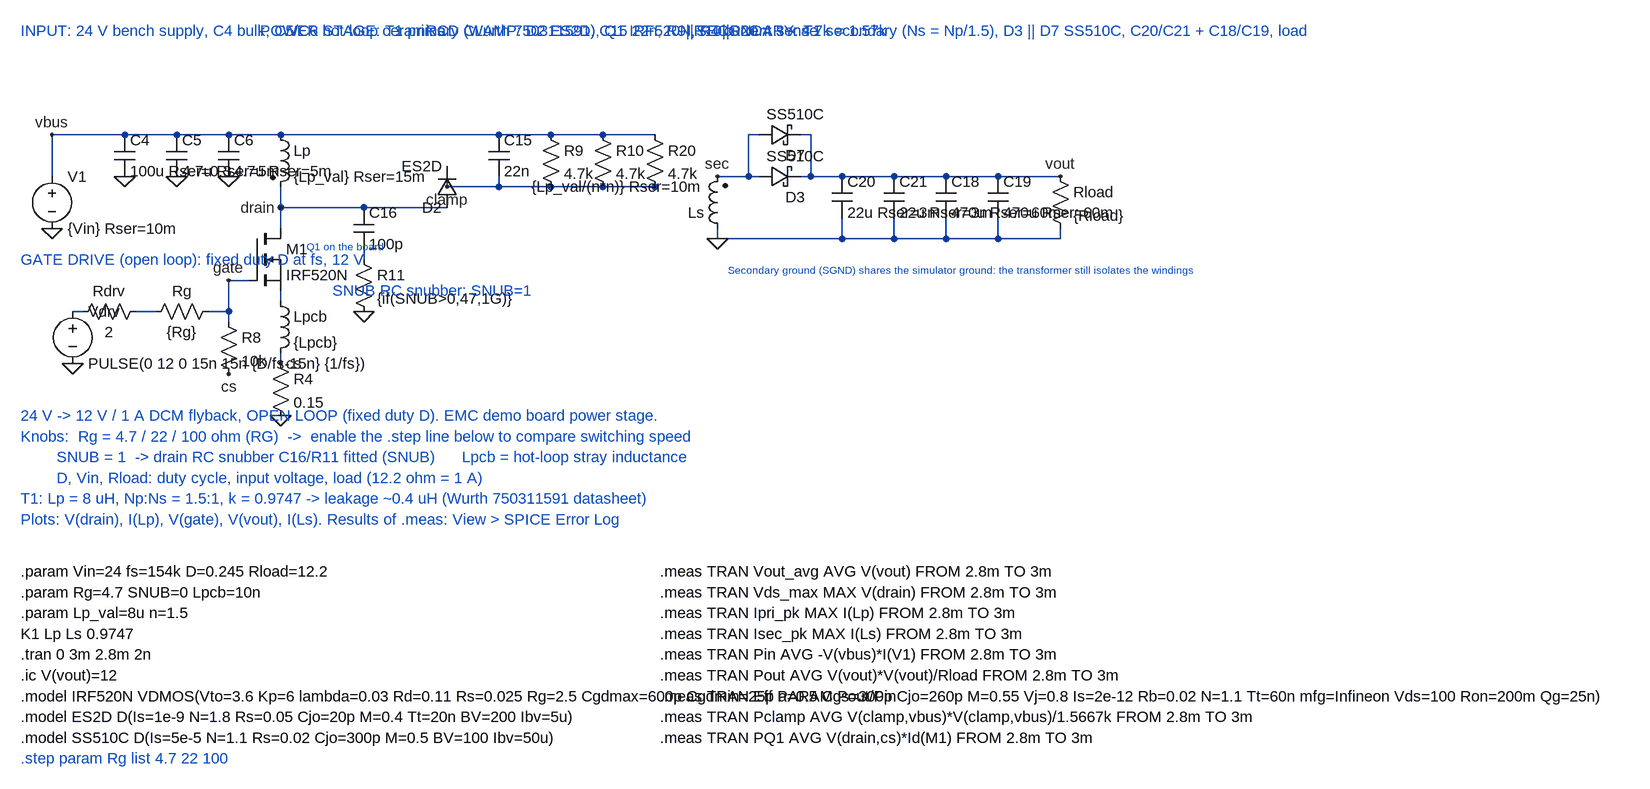
[diagram p0: schematic EMC_flyback_power_stage.asc]
EMC_flyback_power_stage.asc, the LTspice schematic file:
Version 4
SHEET 1 1840 1040
WIRE 64 192 64 128
WIRE 64 128 176 128
WIRE 176 128 256 128
WIRE 256 128 336 128
WIRE 336 128 416 128
WIRE 416 128 752 128
WIRE 752 128 832 128
WIRE 832 128 912 128
WIRE 912 128 992 128
WIRE 416 208 416 240
WIRE 416 240 416 272
WIRE 416 368 416 384
WIRE 416 464 416 480
WIRE 96 400 112 400
WIRE 192 400 224 400
WIRE 304 400 336 400
WIRE 336 400 336 352
WIRE 336 352 368 352
WIRE 336 400 336 416
WIRE 416 240 544 240
WIRE 544 304 544 320
WIRE 544 240 672 240
WIRE 672 176 672 208
WIRE 672 208 752 208
WIRE 752 208 832 208
WIRE 832 208 912 208
WIRE 912 208 992 208
WIRE 752 192 752 208
WIRE 832 208 832 208
WIRE 912 208 912 208
WIRE 992 208 992 208
WIRE 1088 192 1136 192
WIRE 1136 192 1152 192
WIRE 1216 192 1232 192
WIRE 1232 192 1280 192
WIRE 1280 192 1360 192
WIRE 1360 192 1440 192
WIRE 1440 192 1520 192
WIRE 1520 192 1616 192
WIRE 1136 192 1136 128
WIRE 1136 128 1152 128
WIRE 1216 128 1232 128
WIRE 1232 128 1232 192
WIRE 1280 256 1280 288
WIRE 1360 256 1360 288
WIRE 1440 256 1440 288
WIRE 1520 256 1520 288
WIRE 1616 272 1616 288
WIRE 1088 272 1088 288
WIRE 1088 288 1280 288
WIRE 1280 288 1360 288
WIRE 1360 288 1440 288
WIRE 1440 288 1520 288
WIRE 1520 288 1616 288
FLAG 64 272 0
FLAG 176 192 0
FLAG 256 192 0
FLAG 336 192 0
FLAG 64 128 vbus
FLAG 416 240 drain
FLAG 416 560 0
FLAG 416 480 cs
FLAG 96 480 0
FLAG 336 496 cs
FLAG 336 352 gate
FLAG 544 400 0
FLAG 672 208 clamp
FLAG 1088 192 sec
FLAG 1616 192 vout
FLAG 1088 288 0
SYMBOL voltage 64 176 R0
SYMATTR InstName V1
SYMATTR Value {Vin} Rser=10m
SYMBOL cap 160 128 R0
SYMATTR InstName C4
SYMATTR Value 100u Rser=0.3
SYMBOL cap 240 128 R0
SYMATTR InstName C5
SYMATTR Value 4.7u Rser=5m
SYMBOL cap 320 128 R0
SYMATTR InstName C6
SYMATTR Value 4.7u Rser=5m
SYMBOL ind2 400 112 R0
SYMATTR InstName Lp
SYMATTR Value {Lp_val} Rser=15m
SYMBOL nmos 368 272 R0
SYMATTR InstName M1
SYMATTR Value IRF520N
SYMBOL ind 400 368 R0
SYMATTR InstName Lpcb
SYMATTR Value {Lpcb}
SYMBOL res 400 464 R0
SYMATTR InstName R4
SYMATTR Value 0.15
SYMBOL voltage 96 384 R0
SYMATTR InstName Vdrv
SYMATTR Value PULSE(0 12 0 15n 15n {D/fs-15n} {1/fs})
SYMBOL res 208 384 R90
WINDOW 0 0 56 VBottom 2
WINDOW 3 32 56 VTop 2
SYMATTR InstName Rdrv
SYMATTR Value 2
SYMBOL res 320 384 R90
WINDOW 0 0 56 VBottom 2
WINDOW 3 32 56 VTop 2
SYMATTR InstName Rg
SYMATTR Value {Rg}
SYMBOL res 320 400 R0
SYMATTR InstName R8
SYMATTR Value 10k
SYMBOL cap 528 240 R0
SYMATTR InstName C16
SYMATTR Value 100p
SYMBOL res 528 304 R0
SYMATTR InstName R11
SYMATTR Value {if(SNUB>0,47,1G)}
SYMBOL diode 688 240 R180
SYMATTR InstName D2
SYMATTR Value ES2D
SYMBOL cap 736 128 R0
SYMATTR InstName C15
SYMATTR Value 22n
SYMBOL res 816 112 R0
SYMATTR InstName R9
SYMATTR Value 4.7k
SYMBOL res 896 112 R0
SYMATTR InstName R10
SYMATTR Value 4.7k
SYMBOL res 976 112 R0
SYMATTR InstName R20
SYMATTR Value 4.7k
SYMBOL ind2 1104 288 R180
SYMATTR InstName Ls
SYMATTR Value {Lp_val/(n*n)} Rser=10m
SYMBOL schottky 1152 208 R270
WINDOW 0 0 56 VBottom 2
WINDOW 3 32 56 VTop 2
SYMATTR InstName D3
SYMATTR Value SS510C
SYMBOL schottky 1152 144 R270
WINDOW 0 0 56 VBottom 2
WINDOW 3 32 56 VTop 2
SYMATTR InstName D7
SYMATTR Value SS510C
SYMBOL cap 1264 192 R0
SYMATTR InstName C20
SYMATTR Value 22u Rser=3m
SYMBOL cap 1344 192 R0
SYMATTR InstName C21
SYMATTR Value 22u Rser=3m
SYMBOL cap 1424 192 R0
SYMATTR InstName C18
SYMATTR Value 470u Rser=60m
SYMBOL cap 1504 192 R0
SYMATTR InstName C19
SYMATTR Value 470u Rser=60m
SYMBOL res 1600 176 R0
SYMATTR InstName Rload
SYMATTR Value {Rload}
TEXT 16 -32 Left 2 ;INPUT: 24 V bench supply, C4 bulk, C5/C6 hot-loop ceramics
TEXT 384 -32 Left 2 ;POWER STAGE: T1 primary (Wurth 750311591), Q1 IRF520N, R4 current sense
TEXT 456 300 Left 1 ;Q1 on the board
TEXT 16 320 Left 2 ;GATE DRIVE (open loop): fixed duty D at fs, 12 V
TEXT 496 368 Left 2 ;SNUB RC snubber: SNUB=1
TEXT 640 -32 Left 2 ;RCD CLAMP: D2 ES2D, C15 22n, R9||R10||R20 = 3 x 4.7k = 1.57k
TEXT 1056 -32 Left 2 ;SECONDARY: T1 secondary (Ns = Np/1.5), D3 || D7 SS510C, C20/C21 + C18/C19, load
TEXT 1104 336 Left 1 ;Secondary ground (SGND) shares the simulator ground: the transformer still isolates the windings
TEXT 16 560 Left 2 ;24 V -> 12 V / 1 A DCM flyback, OPEN LOOP (fixed duty D). EMC demo board power stage.
TEXT 16 592 Left 2 ;Knobs:  Rg = 4.7 / 22 / 100 ohm (RG)  ->  enable the .step line below to compare switching speed
TEXT 16 624 Left 2 ;        SNUB = 1  -> drain RC snubber C16/R11 fitted (SNUB)      Lpcb = hot-loop stray inductance
TEXT 16 656 Left 2 ;        D, Vin, Rload: duty cycle, input voltage, load (12.2 ohm = 1 A)
TEXT 16 688 Left 2 ;T1: Lp = 8 uH, Np:Ns = 1.5:1, k = 0.9747 -> leakage ~0.4 uH (Wurth 750311591 datasheet)
TEXT 16 720 Left 2 ;Plots: V(drain), I(Lp), V(gate), V(vout), I(Ls). Results of .meas: View > SPICE Error Log
TEXT 16 800 Left 2 !.param Vin=24 fs=154k D=0.245 Rload=12.2
TEXT 16 832 Left 2 !.param Rg=4.7 SNUB=0 Lpcb=10n
TEXT 16 864 Left 2 !.param Lp_val=8u n=1.5
TEXT 16 896 Left 2 !K1 Lp Ls 0.9747
TEXT 16 928 Left 2 !.tran 0 3m 2.8m 2n
TEXT 16 960 Left 2 !.ic V(vout)=12
TEXT 16 992 Left 2 !.model IRF520N VDMOS(Vto=3.6 Kp=6 lambda=0.03 Rd=0.11 Rs=0.025 Rg=2.5 Cgdmax=600p Cgdmin=25p a=0.5 Cgs=300p Cjo=260p M=0.55 Vj=0.8 Is=2e-12 Rb=0.02 N=1.1 Tt=60n mfg=Infineon Vds=100 Ron=200m Qg=25n)
TEXT 16 1024 Left 2 !.model ES2D D(Is=1e-9 N=1.8 Rs=0.05 Cjo=20p M=0.4 Tt=20n BV=200 Ibv=5u)
TEXT 16 1056 Left 2 !.model SS510C D(Is=5e-5 N=1.1 Rs=0.02 Cjo=300p M=0.5 BV=100 Ibv=50u)
TEXT 16 1088 Left 2 ;.step param Rg list 4.7 22 100
TEXT 1000 800 Left 2 !.meas TRAN Vout_avg AVG V(vout) FROM 2.8m TO 3m
TEXT 1000 832 Left 2 !.meas TRAN Vds_max MAX V(drain) FROM 2.8m TO 3m
TEXT 1000 864 Left 2 !.meas TRAN Ipri_pk MAX I(Lp) FROM 2.8m TO 3m
TEXT 1000 896 Left 2 !.meas TRAN Isec_pk MAX I(Ls) FROM 2.8m TO 3m
TEXT 1000 928 Left 2 !.meas TRAN Pin AVG -V(vbus)*I(V1) FROM 2.8m TO 3m
TEXT 1000 960 Left 2 !.meas TRAN Pout AVG V(vout)*V(vout)/Rload FROM 2.8m TO 3m
TEXT 1000 992 Left 2 !.meas TRAN Eff PARAM Pout/Pin
TEXT 1000 1024 Left 2 !.meas TRAN Pclamp AVG V(clamp,vbus)*V(clamp,vbus)/1.5667k FROM 2.8m TO 3m
TEXT 1000 1056 Left 2 !.meas TRAN PQ1 AVG V(drain,cs)*Id(M1) FROM 2.8m TO 3m

The netlist it stands for:
* EMC_flyback_power_stage.asc
V1 vbus 0 {Vin} Rser=10m
C4 vbus 0 100u Rser=0.3
C5 vbus 0 4.7u Rser=5m
C6 vbus 0 4.7u Rser=5m
Lp vbus drain {Lp_val} Rser=15m
M1 drain gate N001 N001 IRF520N
Lpcb N001 cs {Lpcb}
R4 cs 0 0.15
Vdrv N002 0 PULSE(0 12 0 15n 15n {D/fs-15n} {1/fs})
Rdrv N003 N002 2
Rg gate N003 {Rg}
R8 gate cs 10k
C16 drain N004 100p
R11 N004 0 {if(SNUB>0,47,1G)}
D2 drain clamp ES2D
C15 vbus clamp 22n
R9 vbus clamp 4.7k
R10 vbus clamp 4.7k
R20 vbus clamp 4.7k
Ls 0 sec {Lp_val/(n*n)} Rser=10m
D3 sec vout SS510C
D7 sec vout SS510C
C20 vout 0 22u Rser=3m
C21 vout 0 22u Rser=3m
C18 vout 0 470u Rser=60m
C19 vout 0 470u Rser=60m
Rload vout 0 {Rload}
.model D D
.lib standard.dio
.model NMOS NMOS
.model PMOS PMOS
.lib standard.mos
* INPUT: 24 V bench supply, C4 bulk, C5/C6 hot-loop ceramics
* POWER STAGE: T1 primary (Wurth 750311591), Q1 IRF520N, R4 current sense
* Q1 on the board
* GATE DRIVE (open loop): fixed duty D at fs, 12 V
* SNUB RC snubber: SNUB=1
* RCD CLAMP: D2 ES2D, C15 22n, R9||R10||R20 = 3 x 4.7k = 1.57k
* SECONDARY: T1 secondary (Ns = Np/1.5), D3 || D7 SS510C, C20/C21 + C18/C19, load
* Secondary ground (SGND) shares the simulator ground: the transformer still isolates the windings
* 24 V -> 12 V / 1 A DCM flyback, OPEN LOOP (fixed duty D). EMC demo board power stage.
* Knobs:  Rg = 4.7 / 22 / 100 ohm (RG)  ->  enable the .step line below to compare switching speed
*         SNUB = 1  -> drain RC snubber C16/R11 fitted (SNUB)      Lpcb = hot-loop stray inductance
*         D, Vin, Rload: duty cycle, input voltage, load (12.2 ohm = 1 A)
* T1: Lp = 8 uH, Np:Ns = 1.5:1, k = 0.9747 -> leakage ~0.4 uH (Wurth 750311591 datasheet)
* Plots: V(drain), I(Lp), V(gate), V(vout), I(Ls). Results of .meas: View > SPICE Error Log
.param Vin=24 fs=154k D=0.245 Rload=12.2
.param Rg=4.7 SNUB=0 Lpcb=10n
.param Lp_val=8u n=1.5
K1 Lp Ls 0.9747
.tran 0 3m 2.8m 2n
.ic V(vout)=12
.model IRF520N VDMOS(Vto=3.6 Kp=6 lambda=0.03 Rd=0.11 Rs=0.025 Rg=2.5 Cgdmax=600p Cgdmin=25p a=0.5 Cgs=300p Cjo=260p M=0.55 Vj=0.8 Is=2e-12 Rb=0.02 N=1.1 Tt=60n mfg=Infineon Vds=100 Ron=200m Qg=25n)
.model ES2D D(Is=1e-9 N=1.8 Rs=0.05 Cjo=20p M=0.4 Tt=20n BV=200 Ibv=5u)
.model SS510C D(Is=5e-5 N=1.1 Rs=0.02 Cjo=300p M=0.5 BV=100 Ibv=50u)
* .step param Rg list 4.7 22 100
.meas TRAN Vout_avg AVG V(vout) FROM 2.8m TO 3m
.meas TRAN Vds_max MAX V(drain) FROM 2.8m TO 3m
.meas TRAN Ipri_pk MAX I(Lp) FROM 2.8m TO 3m
.meas TRAN Isec_pk MAX I(Ls) FROM 2.8m TO 3m
.meas TRAN Pin AVG -V(vbus)*I(V1) FROM 2.8m TO 3m
.meas TRAN Pout AVG V(vout)*V(vout)/Rload FROM 2.8m TO 3m
.meas TRAN Eff PARAM Pout/Pin
.meas TRAN Pclamp AVG V(clamp,vbus)*V(clamp,vbus)/1.5667k FROM 2.8m TO 3m
.meas TRAN PQ1 AVG V(drain,cs)*Id(M1) FROM 2.8m TO 3m
.backanno
.end